# Altium schematic sheet S12_Connectors.SchDoc
size 420 x 297 mm; SheetNumber: 12; SheetTotal: 11
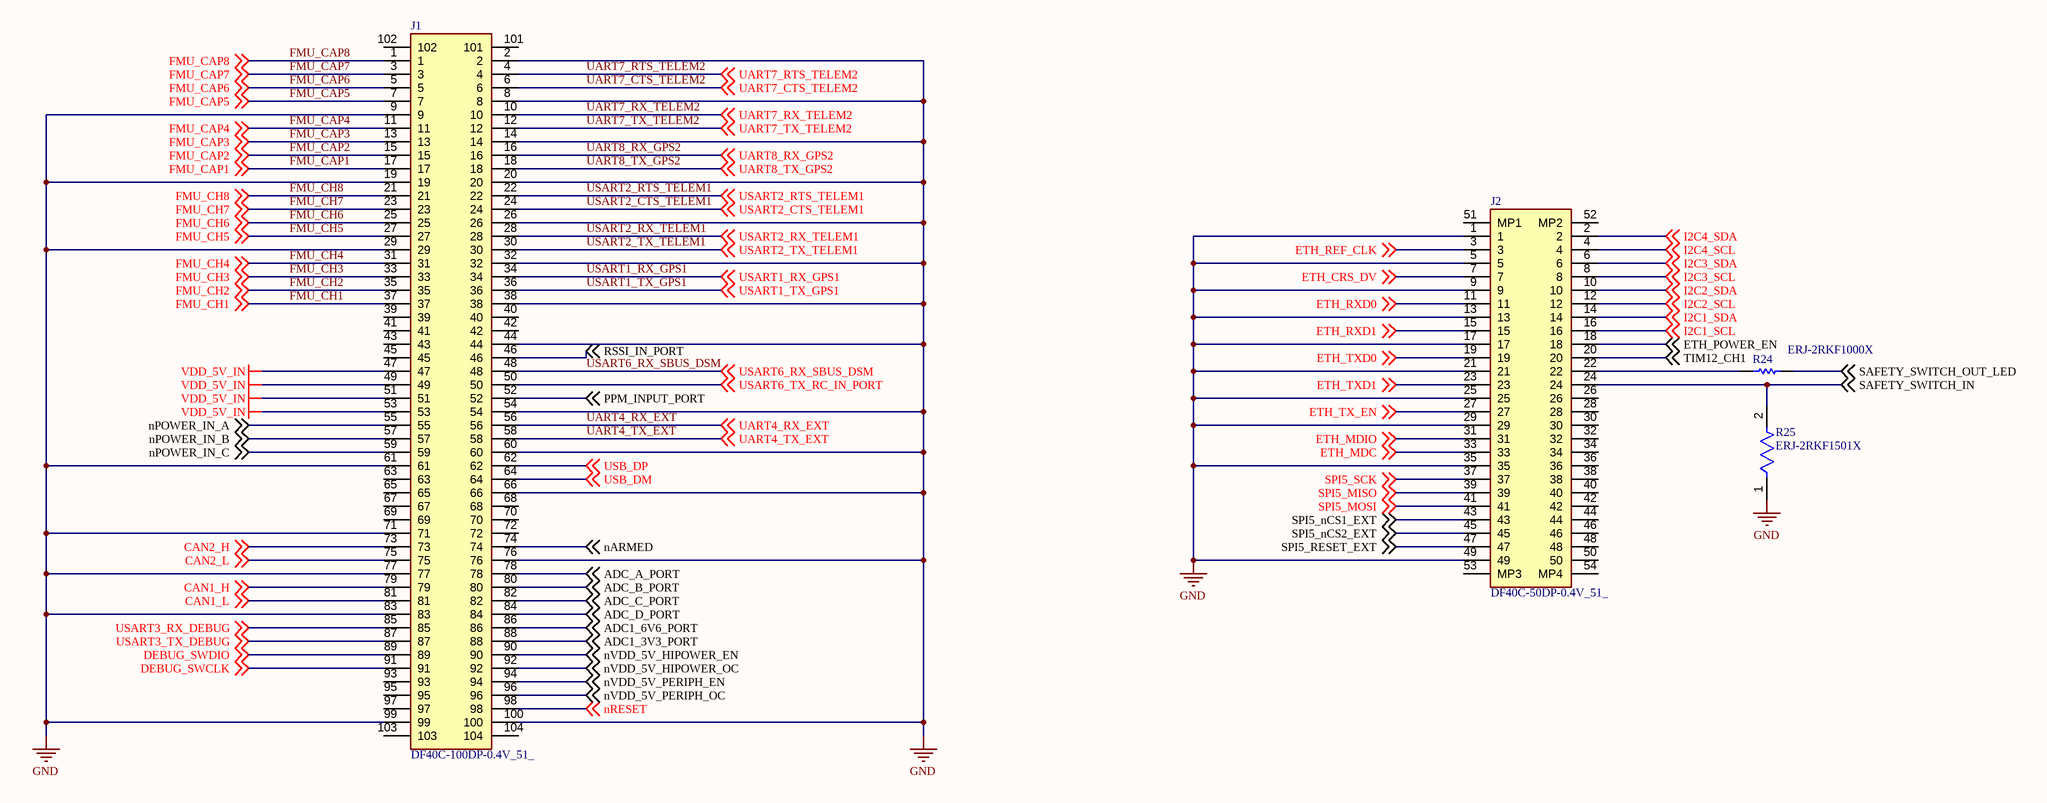
[diagram p0: S12_Connectors.SchDoc]

## Parts
J1  DF40C-100DP-0.4V_51_  [DF40C100DP04V51]
J2  DF40C-50DP-0.4V_51_  [DF40C50DP04V51]
R24  ERJ-2RKF1000X  [RESC1005X40X25LL05T05]
R25  ERJ-2RKF1501X  [FP-ERJ2RK-IPC_A]

## Nets
GND: J1.2 J1.8 J1.9 J1.14 J1.19 J1.20 J1.26 J1.29 J1.32 J1.38 J1.44 J1.54 J1.60 J1.61 J1.66 J1.71 J1.76 J1.77 J1.83 J1.99 J1.100 J2.1 J2.5 J2.9 J2.13 J2.17 J2.21 J2.25 J2.29 J2.35 J2.49 R25.1
VDD_5V_IN: J1.47 J1.49 J1.51 J1.53
ADC1_3V3_PORT: J1.88 ; off-sheet ADC1_3V3_PORT
ADC1_6V6_PORT: J1.86 ; off-sheet ADC1_6V6_PORT
ADC_A_PORT: J1.78 ; off-sheet ADC_A_PORT
ADC_B_PORT: J1.80 ; off-sheet ADC_B_PORT
ADC_C_PORT: J1.82 ; off-sheet ADC_C_PORT
ADC_D_PORT: J1.84 ; off-sheet ADC_D_PORT
CAN1_H: J1.79 ; off-sheet CAN1_H
CAN1_L: J1.81 ; off-sheet CAN1_L
CAN2_H: J1.73 ; off-sheet CAN2_H
CAN2_L: J1.75 ; off-sheet CAN2_L
DEBUG_SWCLK: J1.91 ; off-sheet DEBUG_SWCLK
DEBUG_SWDIO: J1.89 ; off-sheet DEBUG_SWDIO
ETH_CRS_DV: J2.7 ; off-sheet ETH_CRS_DV
ETH_MDC: J2.33 ; off-sheet ETH_MDC
ETH_MDIO: J2.31 ; off-sheet ETH_MDIO
ETH_POWER_EN: J2.18 ; off-sheet ETH_POWER_EN
ETH_REF_CLK: J2.3 ; off-sheet ETH_REF_CLK
ETH_RXD0: J2.11 ; off-sheet ETH_RXD0
ETH_RXD1: J2.15 ; off-sheet ETH_RXD1
ETH_TX_EN: J2.27 ; off-sheet ETH_TX_EN
ETH_TXD0: J2.19 ; off-sheet ETH_TXD0
ETH_TXD1: J2.23 ; off-sheet ETH_TXD1
FMU_CAP1: J1.17 ; off-sheet FMU_CAP1
FMU_CAP2: J1.15 ; off-sheet FMU_CAP2
FMU_CAP3: J1.13 ; off-sheet FMU_CAP3
FMU_CAP4: J1.11 ; off-sheet FMU_CAP4
FMU_CAP5: J1.7 ; off-sheet FMU_CAP5
FMU_CAP6: J1.5 ; off-sheet FMU_CAP6
FMU_CAP7: J1.3 ; off-sheet FMU_CAP7
FMU_CAP8: J1.1 ; off-sheet FMU_CAP8
FMU_CH1: J1.37 ; off-sheet FMU_CH1
FMU_CH2: J1.35 ; off-sheet FMU_CH2
FMU_CH3: J1.33 ; off-sheet FMU_CH3
FMU_CH4: J1.31 ; off-sheet FMU_CH4
FMU_CH5: J1.27 ; off-sheet FMU_CH5
FMU_CH6: J1.25 ; off-sheet FMU_CH6
FMU_CH7: J1.23 ; off-sheet FMU_CH7
FMU_CH8: J1.21 ; off-sheet FMU_CH8
I2C1_SCL: J2.16 ; off-sheet I2C1_SCL
I2C1_SDA: J2.14 ; off-sheet I2C1_SDA
I2C2_SCL: J2.12 ; off-sheet I2C2_SCL
I2C2_SDA: J2.10 ; off-sheet I2C2_SDA
I2C3_SCL: J2.8 ; off-sheet I2C3_SCL
I2C3_SDA: J2.6 ; off-sheet I2C3_SDA
I2C4_SCL: J2.4 ; off-sheet I2C4_SCL
I2C4_SDA: J2.2 ; off-sheet I2C4_SDA
nARMED: J1.74 ; off-sheet nARMED
nPOWER_IN_A: J1.55 ; off-sheet nPOWER_IN_A
nPOWER_IN_B: J1.57 ; off-sheet nPOWER_IN_B
nPOWER_IN_C: J1.59 ; off-sheet nPOWER_IN_C
nRESET: J1.98 ; off-sheet nRESET
nVDD_5V_HIPOWER_EN: J1.90 ; off-sheet nVDD_5V_HIPOWER_EN
nVDD_5V_HIPOWER_OC: J1.92 ; off-sheet nVDD_5V_HIPOWER_OC
nVDD_5V_PERIPH_EN: J1.94 ; off-sheet nVDD_5V_PERIPH_EN
nVDD_5V_PERIPH_OC: J1.96 ; off-sheet nVDD_5V_PERIPH_OC
PPM_INPUT_PORT: J1.52 ; off-sheet PPM_INPUT_PORT
RSSI_IN_PORT: J1.46 ; off-sheet RSSI_IN_PORT
SAFETY_SWITCH_IN: J2.24 R25.2 ; off-sheet SAFETY_SWITCH_IN
SAFETY_SWITCH_OUT_LED: R24.2 ; off-sheet SAFETY_SWITCH_OUT_LED
SPI5_MISO: J2.39 ; off-sheet SPI5_MISO
SPI5_MOSI: J2.41 ; off-sheet SPI5_MOSI
SPI5_nCS1_EXT: J2.43 ; off-sheet SPI5_nCS1_EXT
SPI5_nCS2_EXT: J2.45 ; off-sheet SPI5_nCS2_EXT
SPI5_RESET_EXT: J2.47 ; off-sheet SPI5_RESET_EXT
SPI5_SCK: J2.37 ; off-sheet SPI5_SCK
TIM12_CH1: J2.20 ; off-sheet TIM12_CH1
UART4_RX_EXT: J1.56 ; off-sheet UART4_RX_EXT
UART4_TX_EXT: J1.58 ; off-sheet UART4_TX_EXT
UART7_CTS_TELEM2: J1.6 ; off-sheet UART7_CTS_TELEM2
UART7_RTS_TELEM2: J1.4 ; off-sheet UART7_RTS_TELEM2
UART7_RX_TELEM2: J1.10 ; off-sheet UART7_RX_TELEM2
UART7_TX_TELEM2: J1.12 ; off-sheet UART7_TX_TELEM2
UART8_RX_GPS2: J1.16 ; off-sheet UART8_RX_GPS2
UART8_TX_GPS2: J1.18 ; off-sheet UART8_TX_GPS2
USART1_RX_GPS1: J1.34 ; off-sheet USART1_RX_GPS1
USART1_TX_GPS1: J1.36 ; off-sheet USART1_TX_GPS1
USART2_CTS_TELEM1: J1.24 ; off-sheet USART2_CTS_TELEM1
USART2_RTS_TELEM1: J1.22 ; off-sheet USART2_RTS_TELEM1
USART2_RX_TELEM1: J1.28 ; off-sheet USART2_RX_TELEM1
USART2_TX_TELEM1: J1.30 ; off-sheet USART2_TX_TELEM1
USART3_RX_DEBUG: J1.85 ; off-sheet USART3_RX_DEBUG
USART3_TX_DEBUG: J1.87 ; off-sheet USART3_TX_DEBUG
USART6_RX_SBUS_DSM: J1.48 ; off-sheet USART6_RX_SBUS_DSM
USART6_TX_RC_IN_PORT: J1.50 ; off-sheet USART6_TX_RC_IN_PORT
USB_DM: J1.64 ; off-sheet USB_DM
USB_DP: J1.62 ; off-sheet USB_DP
NetJ2_22: J2.22 R24.1

Not connected (* = marked no-connect by the designer): J1 39 40 41 42 43 45 63 65 67 68 69 70 72 93 95 97 101 102 103 104; J2 26 28 30 32 34 36 38 40 42 44 46 48 50 51(MP1) 52(MP2) 53(MP3) 54(MP4)

## Notes on the sheet
- THIS DOCUMENT AND THE DATA DISCLOSED HEREIN OR
- HEREWITH IS THE PROPERTY OF ALTIUM LIMITED AND MAY
- DWG NO:
- REVISION
- REV:
- DESCRIPTION
- DATE
- APPROVED
- BE FREELY DISTRIBUTED IN WHOLE. NO RIGHTS ARE
- RESERVED OR EXPRESS OR IMPLIED WARANTEE GIVEN.
- ENG:
- APPROVALS
- PROJECT
- DSN:
- CHK:
- REFERENCE DOCUMENTS
- PROJECT REVISION:
- TITLE
- DOCUMENT REVISION:
- DESIGN ITEM:
- BOM:
- FAB DWG:
- PCB DWG:
- ASSY DWG:
- SCALE:
- A3
- SIZE
- CAGE CODE
- FILE NAME
- DWG NO.
- SHEET
- OF
- REV

## Library data of the parts
J1 = CMP-002-00076-1: HIROSE(HRS) - DF40C-100DP-0.4V(51) - CONN, STACKING, HEADER, 100POS, 2ROW; Geometry.Height: 1mm; Manufacturer_Part_Number: DF40C-100DP-0.4V(51); Design Item ID: DF40C-100DP-0.4V_51_; Source: DF40C-100DP-0.4V_51_.SchLib; Mouser Price/Stock: https://www.mouser.co.uk/ProductDetail/Hirose-Connector/DF40C-100DP-0.4V51?qs=eDUdFcBPps2TxbrE27%2Ff2A%3D%3D; Mouser Part Number: 798-DF40C100DP0.4V51; Datasheet Link: https://datasheet.datasheetarchive.com/originals/distributors/SFDatasheet-7/sf-000141247.pdf; Manufacturer_Name: Hirose
J2 = CMP-007-000001-1: HIROSE(HRS) - DF40C-50DP-0.4V(51) - STIFTLEISTE, STAPELBAR, 50POS., 2 REIHEN; Geometry.Height: 1.29mm; Mouser Part Number: 798-DF40C50DP0.4V51; Manufacturer_Name: Hirose; Datasheet Link: https://www.hirose.com/en/product/document?clcode=CL0684-4014-0-51&productname=DF40C-50DP-0.4V(51)&series=DF40&documenttype=2DDrawing&lang=en&documentid=0001001212; Manufacturer_Part_Number: DF40C-50DP-0.4V(51); Mouser Price/Stock: https://www.mouser.co.uk/ProductDetail/Hirose-Connector/DF40C-50DP-0.4V51?qs=eDUdFcBPps0UZyNZPNBu5A%3D%3D; Design Item ID: DF40C-50DP-0.4V_51_; Source: DF40C-50DP-0.4V_51_.SchLib
R24 = CMP-2002-00605-3: Chip Resistor, 100 Ohm, +/- 1%, 100 mW, -55 to 155 degC, 0402 (1005 Metric), RoHS, Tape and Reel; Manufacturer: Basic Passives; Power Rating: 100 mW; Resistance: 100 Ohm; Voltage Rating: 50 V; Case\/Package: 0402; Width: 0.5 mm; Pins: 2; ComponentLink2Description: Datasheet; PackageReference: 0402; Height: 0.35 mm; Tolerance: 1%; DatasheetVersion: 04/2015; Case Code (Imperial): 0402; Min Operating Temperature: -55 degC; Radiation Hardening: No; Length: 1 mm; Package Quantity: 10000; PackageDescription: 2-Pin Surface Mount Device, Body 1 x 0.5 mm; Mounting Technology: Surface Mount; Case Code (Metric): 1005; Packaging: Tape and Reel; ComponentLink1URL: http://www.panasonic.com/; RoHSCompliant: true; Max Operating Temperature: 155 degC; REACH SVHC: Yes; PartNumber: ERJ-2RKF1000X; ComponentLink1Description: Manufacturer URL; ComponentLink2URL: http://industrial.panasonic.com/cdbs/www-data/pdf/RDA0000/AOA0000C86.pdf; Mount: Surface Mount
R25 = CMP-2002-00693-2: RES SMD 1.5K OHM 1% 1/10W 0402; Voltage Rating (DC): 50V; Temperature Coefficient: 100ppm/°C; Power Rating: 100mW; Resistance: 1.5kR; Features: Automotive AEC-Q200; Termination: SMD/SMT; Size Code: 0402; Mount: Surface Mount; Min Operating Temperature: -55°C; Construction: Rectangular; Case Code (Metric): 1005; Depth: 0.5mm; Max Operating Temperature: 155°C; RoHS Compliant: Yes; Packaging: Tape and Reel; Number of Pins: 2; Military Standard: Not; Package Quantity: 1; Height: 0.35mm; Resistor Type: Thick Film; Radiation Hardening: No; Length: 1mm; Case Code (Imperial): 0402; Tolerance: 1%; Voltage Rating: 50V; Resistance Tolerance: 1%; Contact Plating: Tin; Case/Package: 0402; REACH SVHC: No SVHC; Max Power Dissipation: 100mW; Series: ERJ; Technology: THICK FILM; Number of Terminations: 2; Width: 0.02inch; Lead Free: Lead Free